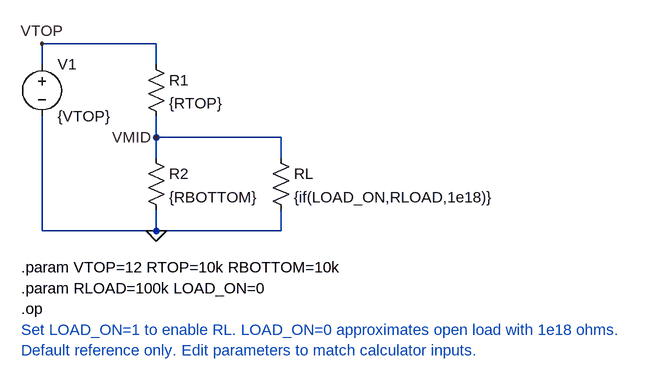
[diagram p0: schematic voltage_divider.asc]
voltage_divider.asc, the LTspice schematic file:
Version 4.1
SHEET 1 1060 680
WIRE 272 80 96 80
WIRE 96 112 96 80
WIRE 272 112 272 80
WIRE 272 224 272 192
WIRE 464 224 272 224
WIRE 272 256 272 224
WIRE 464 256 464 224
WIRE 96 368 96 192
WIRE 272 368 272 336
WIRE 272 368 96 368
WIRE 464 368 464 336
WIRE 464 368 272 368
FLAG 96 80 VTOP
FLAG 272 224 VMID
FLAG 272 368 0
SYMBOL voltage 96 96 R0
WINDOW 123 0 0 Left 0
WINDOW 39 0 0 Left 0
SYMATTR InstName V1
SYMATTR Value {VTOP}
SYMBOL res 256 96 R0
SYMATTR InstName R1
SYMATTR Value {RTOP}
SYMBOL res 256 240 R0
SYMATTR InstName R2
SYMATTR Value {RBOTTOM}
SYMBOL res 448 240 R0
SYMATTR InstName RL
SYMATTR Value {if(LOAD_ON,RLOAD,1e18)}
TEXT 64 424 Left 2 !.param VTOP=12 RTOP=10k RBOTTOM=10k
TEXT 64 456 Left 2 !.param RLOAD=100k LOAD_ON=0
TEXT 64 488 Left 2 !.op
TEXT 64 520 Left 2 ;Set LOAD_ON=1 to enable RL. LOAD_ON=0 approximates open load with 1e18 ohms.
TEXT 64 552 Left 2 ;Default reference only. Edit parameters to match calculator inputs.

The netlist it stands for:
* voltage_divider.asc
V1 VTOP 0 {VTOP}
R1 VTOP VMID {RTOP}
R2 VMID 0 {RBOTTOM}
RL VMID 0 {if(LOAD_ON,RLOAD,1e18)}
.param VTOP=12 RTOP=10k RBOTTOM=10k
.param RLOAD=100k LOAD_ON=0
.op
* Set LOAD_ON=1 to enable RL. LOAD_ON=0 approximates open load with 1e18 ohms.
* Default reference only. Edit parameters to match calculator inputs.
.backanno
.end